# Altium schematic sheet Connect.SchDoc
size A4
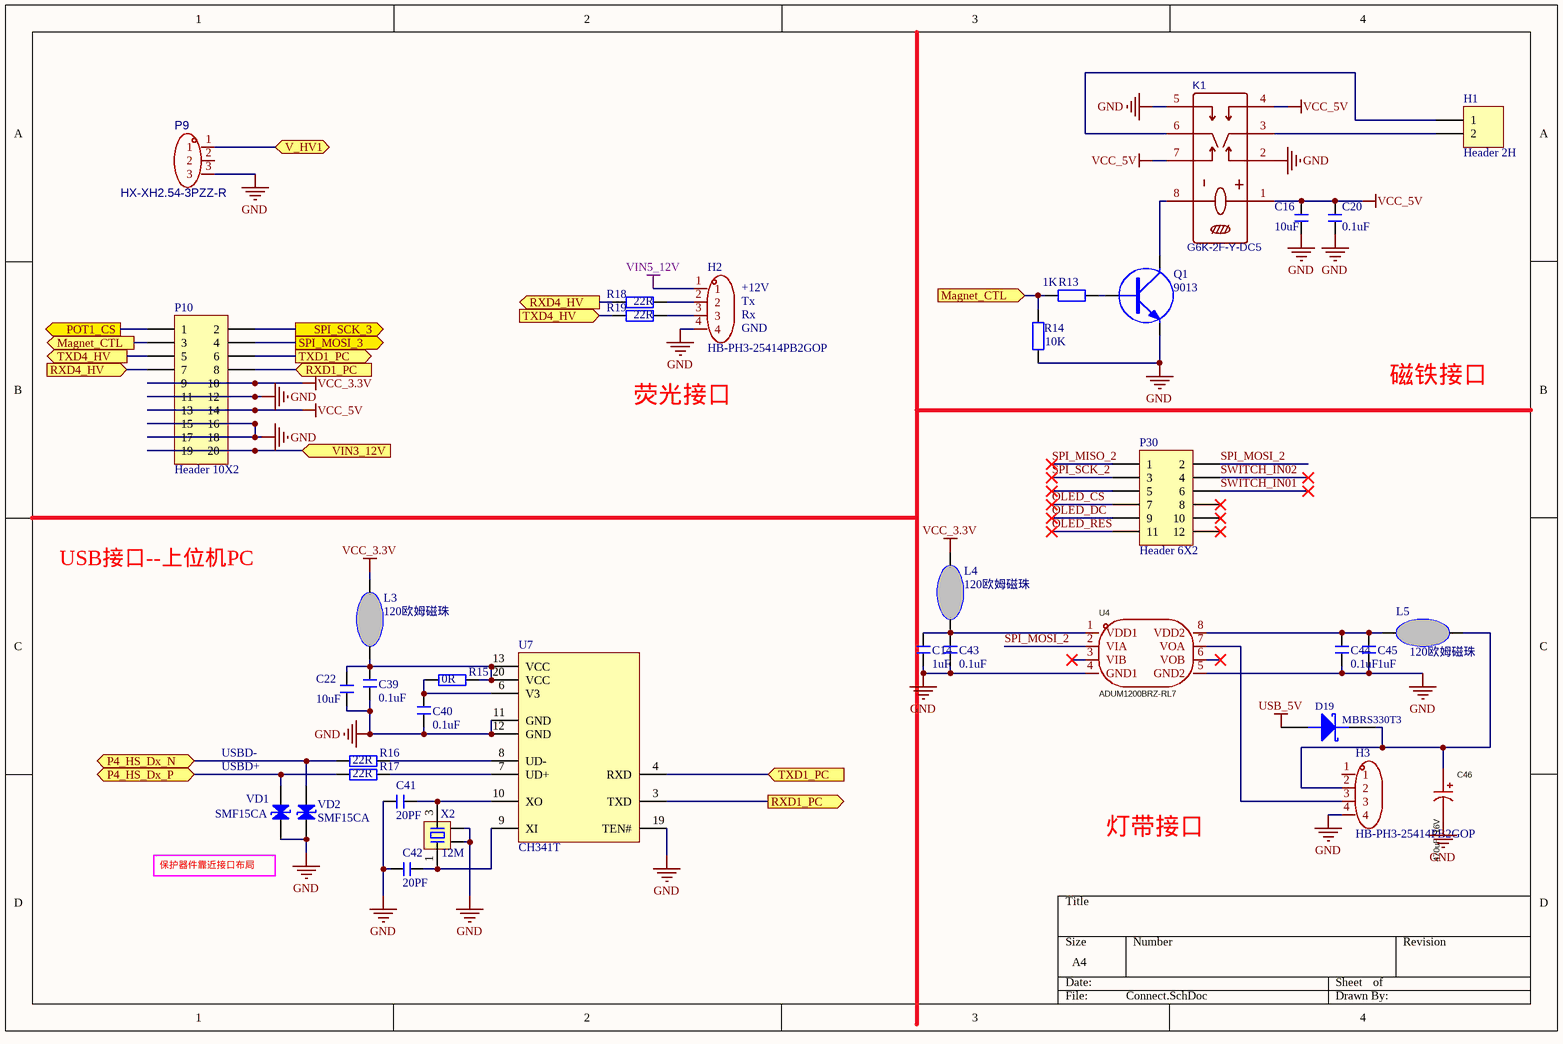
[diagram p0: Connect.SchDoc]

## Parts
C14  1uF  [C 0603]
C16  10uF  [C 0805]
C20  0.1uF  [C 0603]
C22  10uF  [C 0805]
C39  0.1uF  [C 0603]
C40  0.1uF  [C 0603]
C41  20PF  [C 0603]
C42  20PF  [C 0603]
C43  0.1uF  [C 0603]
C44  0.1uF  [C 0603]
C45  1uF  [C 0603]
C46  470uF /16V  [CAP-TH_BD8.0-P3.50-D0.6-FD]
D19  MBRS330T3  [MBRS340]
H1  Header 2H  [CONN-TH_2P-P2.54_ZX-XH2.54-2PZZ-Y]
H2  HB-PH3-25414PB2GOP  [CONN-TH_4P-P2.50_ZX-XH2.54-4PZZ-Y]
H3  HB-PH3-25414PB2GOP  [CONN-TH_4P-P2.50_ZX-XH2.54-4PZZ-Y]
K1  G6K-2F-Y-DC5  [RELAY-SMD_G6K-2F-Y]
L3  120欧姆磁珠  [L 0603]
L4  120欧姆磁珠  [L 0603]
L5  120欧姆磁珠  [L 0603]
P9  HX-XH2.54-3PZZ-R  [CONN-TH_3P-P2.50_HX-XH2.54-3PZZ-B]
P10  Header 10X2  [HDR-10X2]
P30  Header 6X2  [HDR-6X2]
Q1  9013  [SOT23]
R13  1K  [R 0603]
R14  10K  [R 0603]
R15  0R  [R 0603]
R16  22R  [R 0603]
R17  22R  [R 0603]
R18  22R  [R 0603]
R19  22R  [R 0603]
U4  ADUM1200BRZ-RL7  [SOIC-8_L4.9-W3.9-P1.27-LS6.0-BL]
U7  CH341T  [SSOP-20]
VD1  SMF15CA  [SOD-123F]
VD2  SMF15CA  [SOD-123F]
X2  12M  [XTAL-3225]

## Ports
Magnet_CTL (in), Magnet_CTL (out), P4_HS_Dx_N (bidir), P4_HS_Dx_P (bidir), POT1_CS (out), RXD1_PC (in), RXD1_PC (out), RXD4_HV (in), RXD4_HV (out), SPI_MOSI_3 (out), SPI_SCK_3 (out), TXD1_PC (in), TXD1_PC (out), TXD4_HV (in), TXD4_HV (out), V_HV1, VIN3_12V (in)

## Nets
GND: C14.2 C16.1 C20.1 C22.1 C39.1 C40.1 C41.2 C42.2 C43.2 C44.2 C45.2 C46.2 H2.4 H3.4 K1.2 K1.5 P9.3 P10.11 P10.12 P10.15 P10.16 P10.17 P10.18 Q1.2 R14.2 U4.4(GND1) U4.5(GND2) U7.11(GND) U7.12(GND) U7.19(TEN#) VD1.2(K) VD2.2(K) X2.2 X2.4
USB_5V: D19.1(A)
VCC_3.3V: L3.1 L4.1 P10.9 P10.10
VCC_5V: C16.2 C20.2 K1.1 K1.4 K1.7 P10.13 P10.14
VIN5_12V: H2.1
Magnet_CTL: P10.3 R13.1 R14.1 ; port Magnet_CTL
OLED_CS: P30.7
OLED_DC: P30.9
OLED_RES: P30.11
P4_HS_Dx_N: R16.2 VD2.1(A) ; port P4_HS_Dx_N
P4_HS_Dx_P: R17.2 VD1.1(A) ; port P4_HS_Dx_P
POT1_CS: P10.1 ; port POT1_CS
RXD1_PC: P10.8 U7.3(TXD) ; port RXD1_PC
RXD4_HV: P10.7 R18.2 ; port RXD4_HV
SPI_MISO_2: P30.1
SPI_MOSI_2: P30.2 U4.2(VIA)
SPI_MOSI_3: P10.4 ; port SPI_MOSI_3
SPI_SCK_2: P30.3
SPI_SCK_3: P10.2 ; port SPI_SCK_3
SWITCH_IN01: P30.6
SWITCH_IN02: P30.4
TXD1_PC: P10.6 U7.4(RXD) ; port TXD1_PC
TXD4_HV: P10.5 R19.2 ; port TXD4_HV
V_HV1: P9.1 ; port V_HV1
VIN3_12V: P10.19 P10.20 ; port VIN3_12V
NetC14_1: C14.1 C43.1 L4.2 U4.1(VDD1)
NetC22_2: C22.2 C39.2 L3.2 R15.1 U7.13(VCC) U7.20(VCC)
NetC40_2: C40.2 R15.2 U7.6(V3)
NetC41_1: C41.1 U7.10(XO) X2.3
NetC42_1: C42.1 U7.9(XI) X2.1
NetC44_1: C44.1 C45.1 L5.1 U4.8(VDD2)
NetC46_1: C46.1 D19.2(K) H3.2 L5.2
NetH1_1: H1.1 K1.6
NetH1_2: H1.2 K1.3
NetH2_2: H2.2 R18.1
NetH2_3: H2.3 R19.1
NetH3_3: H3.3 U4.7(VOA)
NetK1_8: K1.8 Q1.3
NetQ1_1: Q1.1 R13.2
NetR16_1: R16.1 U7.8(UD-)
NetR17_1: R17.1 U7.7(UD+)

Not connected (* = marked no-connect by the designer): H3 1; P9 2; P30 5* 8* 10* 12*; U4 3(VIB)* 6(VOB)*

## Notes on the sheet
- (near H2) Tx
- (near H2) +12V
- (near H2) Rx
- (near H2) GND
- 磁铁接口
- 荧光接口
- USB接口--上位机PC
- USBD-
- USBD+
- 灯带接口
- 保护器件靠近接口布局

## Library data of the parts
C14 C16 C20 C43-C45 = C-CC: 直插瓷片电容; 版权归属: 源创客; BOM名称: 直插瓷片电容; 学习资源: www.ooocke.com
C22 C39-C42 = C: 无极性贴片电容; 版权归属: 源创客; BOM名称: 无极性贴片电容; 学习资源: www.ooocke.com
C46 = JBLE2471M016D090RLM 470UF 16V: Add into BOM: yes; Rated Voltage: 16V; Ripple Current: 3.7A@100kHz; Symbol: JBLE2471M016D090RLM 470UF 16V; Device: JBLE2471M016D090RLM 470UF 16V; Supplier Part: C19270650; Manufacturer Part: JBLE2471M016D090RLM 470UF 16V; JLCPCB Part Class: Extended Part; Datasheet: https://atta.szlcsc.com/upload/public/pdf/source/20240115/1E5B34C3EFC94403EAAAB66897201DA6.pdf; Supplier: LCSC; Convert to PCB: yes; Value: 470uF
D19 = DIODE SCHOTTKY: Schottky Diode
H1 = Header 2H: Header, 2-Pin, Right Angle; LatestRevisionDate: 17-Jul-2002; LatestRevisionNote: Re-released for DXP Platform.; Publisher: Altium Limited
H2 H3 = HB-PH3-25414PB2GOP: Add into BOM: yes; Pin Structure: 1x4P; Pitch: 2.54mm; Current Rating (Max): 3A; Voltage Rating (Max): 250V; Symbol: HB-PH3-25414PB2GOP; Device: HB-PH3-25414PB2GOP; Supplier Part: C6332197; Manufacturer Part: HB-PH3-25414PB2GOP; Datasheet: https://atta.szlcsc.com/upload/public/pdf/source/20230803/F72D259687963761DF1B552F3BB84A31.pdf; Supplier: LCSC; Convert to PCB: yes; Row Spacing: 2.54mm; Number of Pins: 4P; Length of Mating Pin: 6mm; Insulation Height: 2.54mm; Length of End Connection Pin: 3mm; Comment_1: HB-PH3-25414PB2GOP
K1 = G6K-2F-Y-DC12: BOM_Manufacturer: Omron Electronics; Contributor: LCSC; BOM_Supplier: LCSC; BOM_Supplier Part: C397194; BOM_Manufacturer Part: G6K-2F-Y-DC12; BOM_JLCPCB Part Class: Extended Part; spicePre: K; spiceSymbolName: G6K-2F-Y-DC12
L3-L5 = FERRITBEAD
P9 = HX-XH2.54-3PZZ-R: AddInBom: yes; Pins Structure: 1x3P; Pitch: 2.54mm; Reference Series: XH; Number of PINs Per Row: 3; Current Rating: 3A; Voltage Rating: 250V; Plastic Material: PA66; Flame Retardant Rating: UL94V-0; Symbol: HX-XH2.54-3PZZ-R; Device: HX-XH2.54-3PZZ-R; SupplierPart: C49010011; ManufacturerPart: HX-XH2.54-3PZZ-R; JLCPCB Part Class: Extended Part; Datasheet: https://item.szlcsc.com/datasheet/HX-XH2.54-3PZZ-R/51365932.html; Supplier: LCSC; ConvertToPcb: yes; FootprintName: CONN-TH_3P-P2.50_HX-XH2.54-3PZZ-B; Number of Pins: 3P; Number of Rows: 1; Row Spacing: -; Supplementary Features: -; Z-Height of the Board: -; X-Length of Bottom Edge on Board (Spacing Line): -; Y-Width of Bottom Edge on Board: -
P10 = Header 10X2: Header, 10-Pin, Dual row; LatestRevisionDate: 17-Jul-2002; LatestRevisionNote: Re-released for DXP Platform.; Publisher: Altium Limited
P30 = Header 6X2: Header, 6-Pin, Dual row; LatestRevisionDate: 17-Jul-2002; LatestRevisionNote: Re-released for DXP Platform.; Publisher: Altium Limited
Q1 = 2N2222: value: 9013
R13 R14 = Res2: Resistor; Published: 8-Jun-2000; LatestRevisionDate: 17-Jul-2002; LatestRevisionNote: Re-released for DXP Platform.; PackageReference: AXIAL-0.4; Publisher: Altium Limited
  R13: Value: 1K
  R14: Value: 10K
R15-R19 = R: 贴片电阻; 版权归属: 源创客; BOM名称: 贴片电阻; 学习资源: www.ooocke.com
U4 = ADUM1200BRZ-RL7: Add into BOM: yes; Number of Forward Channels: 2; Number of Reverse Channels: 0; Data Rate(Max): 25Mbps; Isolation Voltage(Vrms): 2500; CMTI(kV/us): 25kV/us; Symbol: ADUM1200BRZ; Device: ADUM1200BRZ-RL7; Supplier Part: C30230; Manufacturer Part: ADUM1200BRZ-RL7; Supplier Footprint: SOIC-8; JLCPCB Part Class: Extended Part; Datasheet: https://atta.szlcsc.com/upload/public/pdf/source/20140418/1457707045216.pdf; Supplier: LCSC; Convert to PCB: yes; Default Output: -; Rating: -; Comment_1: ADUM1200BRZ-RL7
VD1 VD2 = DR: 瞬态电压抑制二极管; 版权归属: 源创客; BOM名称: 瞬态电压抑制二极管; 学习资源: www.ooocke.com
X2 = XTAL-4: 4脚晶振; 版权归属: 源创客; BOM名称: 4脚晶振; 学习资源: www.ooocke.com